# Altium schematic sheet Top_Sheet.SchDoc
size A4
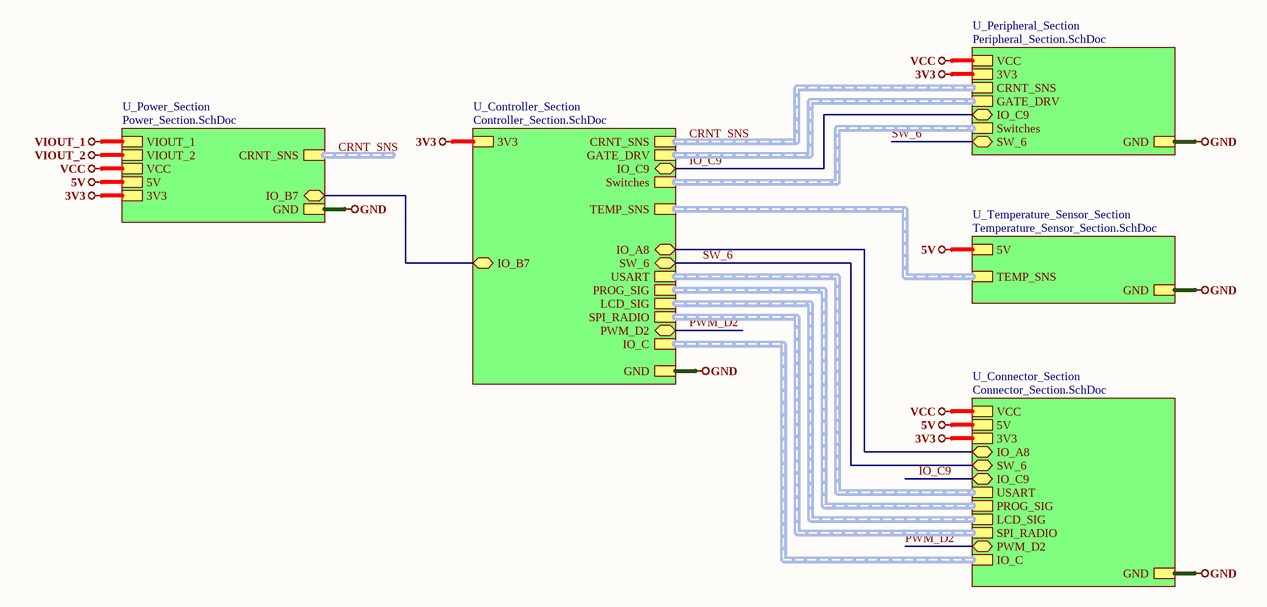
[diagram p0: Top_Sheet.SchDoc]

## Sub-sheets
U_Connector_Section = Connector_Section.SchDoc: LCD_SIG (harness LCD_SIG), PROG_SIG (harness PROG_SIG), USART (harness DEBUG), IO_A8 (bidir), SW_6 (bidir), VCC, 5V, 3V3, GND, SPI_RADIO (harness SPI_RADIO), PWM_D2 (bidir), IO_C (harness SPI_RADIO), IO_C9 (bidir)
U_Controller_Section = Controller_Section.SchDoc: Switches (harness Switches), LCD_SIG (harness LCD_SIG), PROG_SIG (harness PROG_SIG), USART (harness DEBUG), IO_A8 (bidir), CRNT_SNS (harness CRNT_SNS), TEMP_SNS (harness TEMP_SNS), SW_6 (bidir), GATE_DRV (harness GATE_DRV), IO_C9 (bidir), GND, 3V3, IO_B7 (bidir), SPI_RADIO (harness SPI_RADIO), PWM_D2 (bidir), IO_C (harness SPI_RADIO)
U_Peripheral_Section = Peripheral_Section.SchDoc: VCC, GND, 3V3, GATE_DRV (harness GATE_DRV), IO_C9 (bidir), Switches (harness Switches), SW_6 (bidir), CRNT_SNS (harness CRNT_SNS)
U_Power_Section = Power_Section.SchDoc: VIOUT_1, VIOUT_2, VCC, 5V, 3V3, GND, CRNT_SNS (harness CRNT_SNS), IO_B7 (bidir)
U_Temperature_Sensor_Section = Temperature_Sensor_Section.SchDoc: TEMP_SNS (harness TEMP_SNS), 5V, GND

## Nets
3V3: sheet U_Power_Section/3V3, sheet U_Controller_Section/3V3, sheet U_Connector_Section/3V3, sheet U_Peripheral_Section/3V3
5V: sheet U_Power_Section/5V, sheet U_Connector_Section/5V, sheet U_Temperature_Sensor_Section/5V
GND: sheet U_Power_Section/GND, sheet U_Controller_Section/GND, sheet U_Connector_Section/GND, sheet U_Peripheral_Section/GND, sheet U_Temperature_Sensor_Section/GND
VCC: sheet U_Power_Section/VCC, sheet U_Connector_Section/VCC, sheet U_Peripheral_Section/VCC
VIOUT_1: sheet U_Power_Section/VIOUT_1
VIOUT_2: sheet U_Power_Section/VIOUT_2
IO_C9: sheet U_Controller_Section/IO_C9, sheet U_Connector_Section/IO_C9, sheet U_Peripheral_Section/IO_C9
PWM_D2: sheet U_Controller_Section/PWM_D2, sheet U_Connector_Section/PWM_D2
SW_6: sheet U_Controller_Section/SW_6, sheet U_Connector_Section/SW_6, sheet U_Peripheral_Section/SW_6
(unnamed): sheet U_Power_Section/IO_B7, sheet U_Controller_Section/IO_B7
(unnamed): sheet U_Controller_Section/IO_A8, sheet U_Connector_Section/IO_A8

## Buses and harness runs
harness CRNT_SNS = sheet U_Controller_Section/CRNT_SNS = sheet U_Peripheral_Section/CRNT_SNS
harness CRNT_SNS = sheet U_Power_Section/CRNT_SNS
harness sheet U_Connector_Section/IO_C = sheet U_Controller_Section/IO_C
harness sheet U_Connector_Section/LCD_SIG = sheet U_Controller_Section/LCD_SIG
harness sheet U_Connector_Section/PROG_SIG = sheet U_Controller_Section/PROG_SIG
harness sheet U_Connector_Section/SPI_RADIO = sheet U_Controller_Section/SPI_RADIO
harness sheet U_Connector_Section/USART = sheet U_Controller_Section/USART
harness sheet U_Controller_Section/GATE_DRV = sheet U_Peripheral_Section/GATE_DRV
harness sheet U_Controller_Section/Switches = sheet U_Peripheral_Section/Switches
harness sheet U_Controller_Section/TEMP_SNS = sheet U_Temperature_Sensor_Section/TEMP_SNS